# Altium schematic sheet Power Sheet1.SchDoc
size 420 x 297 mm; SheetNumber: 1; SheetTotal: 6
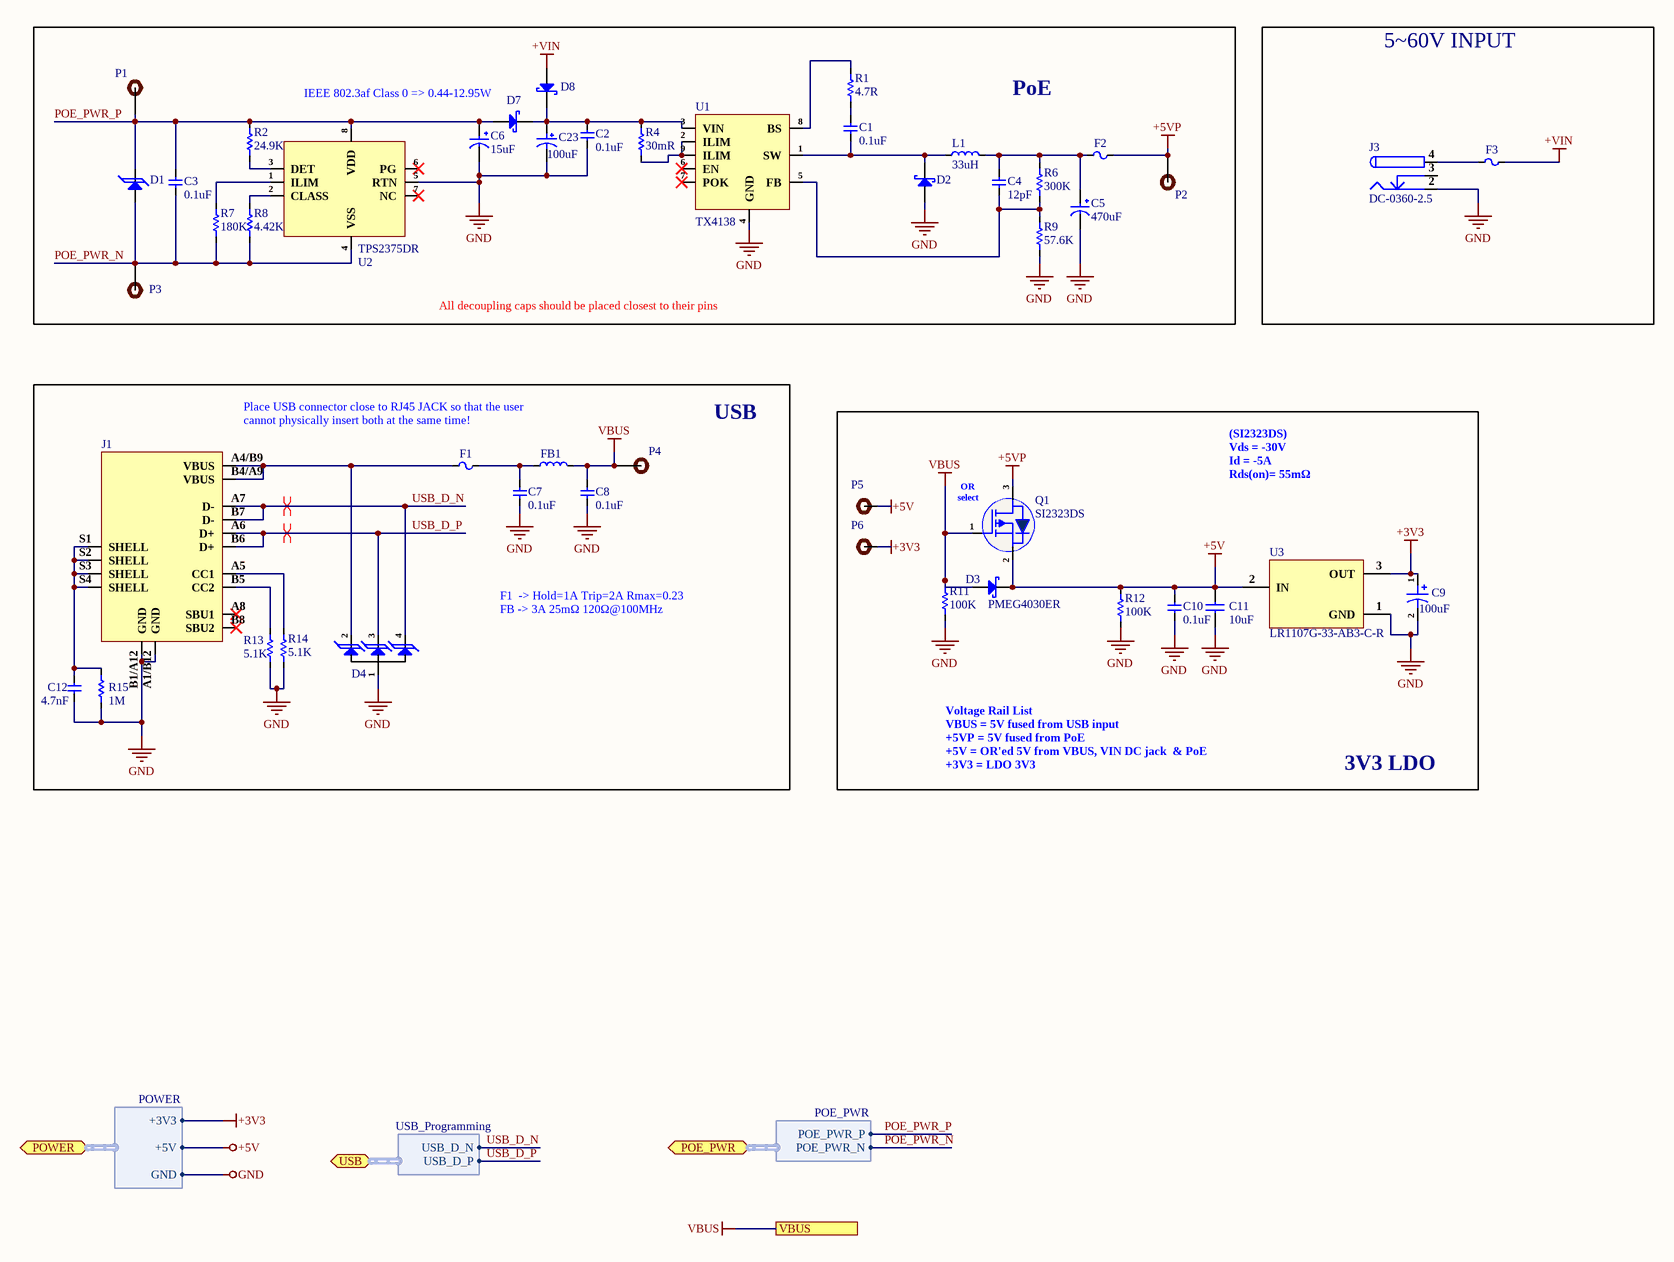
[diagram p0: Power Sheet1.SchDoc]

## Parts
C1  0.1uF  [Cap-0603]
C2  0.1uF  [Cap-0603]
C3  0.1uF  [Cap-0603]
C4  12pF  [Cap-0603]
C5  470uF  [VZH471M1CTR-0810]
C6  15uF  [UD2C150M1010]
C7  0.1uF  [Cap-0402]
C8  0.1uF  [Cap-0402]
C9  100uF  [UCD1A101MCL1GS]
C10  0.1uF  [Cap-0402]
C11  10uF  [Cap-0603]
C12  4.7nF  [Cap-1206]
C23  100uF  [VKMD1451K101MV]
D1  SMAJ58A  [SMA]  (value not drawn)
D2  SS510B  [SMB_]  (value not drawn)
D3  PMEG4030ER  [SOD-123FL]
D4  SP0503BAHTG  [SOT-143-4_]  (value not drawn)
D7  SS510B  [SMB_]  (value not drawn)
D8  SS510B  [SMB_]  (value not drawn)
F1  BSMD0805L-200  [Fuse-0805]  (value not drawn)
F2  BSMD0805L-200  [Fuse-0805]  (value not drawn)
F3  JFC1206-1100FS  [Fuse 1206 (3216 Metric)]  (value not drawn)
FB1  BLM18SG121TN1D  [IND-0603 (1608 Metric)]  (value not drawn)
J1  TYPE-C-31-M-12  [TYPE-C-31-M-12_]  (value not drawn)
J3  DC-0360-2.5  [DC-0360-2.5]
L1  33uH  [CYH127-33UH]
P1  TEST POINT  [Test-point]  (value not drawn)
P2  TEST POINT  [Test-point]  (value not drawn)
P3  TEST POINT  [Test-point]  (value not drawn)
P4  TEST POINT  [Test-point]  (value not drawn)
P5  TEST POINT  [Test-point]  (value not drawn)
P6  TEST POINT  [Test-point]  (value not drawn)
Q1  SI2323DS  [SOT-23]
R1  4.7R  [Res-0603]
R2  24.9K  [Res-0402]
R4  30mR  [RES-0805]
R6  300K  [Res-0603]
R7  180K  [Res-0603]
R8  4.42K  [Res-0603]
R9  57.6K  [Res-0603]
R11  100K  [Res-0603]
R12  100K  [Res-0603]
R13  5.1K  [Res-0402]
R14  5.1K  [Res-0402]
R15  1M  [Res-0603]
U1  TX4138  [8-SOIC-EP]
U2  TPS2375DR  [SOIC-8]
U3  LR1107G-33-AB3-C-R  [SOT-89-3]

## Blocks framed on the sheet
PoE: C1-C6 C23 D1 D2 D7 D8 F2 L1 P1-P3 R1 R2 R4 R6-R9 U1 U2
5~60V INPUT: F3 J3
USB: C7 C8 C12 D4 F1 FB1 J1 P4 R13-R15
3V3 LDO: C9-C11 D3 P5 P6 Q1 R11 R12 U3

## Ports
POE_PWR (bidir, harness POE_PWR), POWER (bidir, harness POWER), USB (bidir, harness USB_Programming), VBUS

## Harnesses
POWER: +3V3, +5V, GND
USB_Programming: USB_D_N, USB_D_P
POE_PWR: POE_PWR_P, POE_PWR_N

## Nets
+3V3: C9.1 P6.1 U3.3(OUT) ; port POWER.+3V3
+5V: C10.2 C11.1 D3.1(K) P5.1 Q1.2(S) R12.2 U3.2(IN) ; port POWER.+5V
+5VP: F2.2 P2.1 Q1.3(D)
+VIN: D8.1(A) F3.2
GND: C2.1 C5.2 C6.2 C7.1 C8.1 C9.2 C10.1 C11.2 C12.2 C23.2 D2.1(A) D4.1(A) J1.A1/B12(GND) J1.B1/A12(GND) J3.2 R9.1 R11.1 R12.1 R13.1 R14.1 R15.2 U1.4(GND) U2.5(RTN) U3.1(GND) ; port POWER.GND
VBUS: C8.2 D3.2(A) FB1.2 P4.1 Q1.1(G) R11.2 ; port VBUS
POE_PWR_N: C3.1 D1.2(K) P3.1 R7.1 R8.1 U2.4(VSS) ; port POE_PWR.POE_PWR_N
POE_PWR_P: C3.2 C6.1 D1.1(K) D7.1(A) P1.1 R2.2 U2.8(VDD) ; port POE_PWR.POE_PWR_P
USB_D_N: D4.4(K) J1.A7(D-) J1.B7(D-) ; port USB.USB_D_N
USB_D_P: D4.3(K) J1.A6(D+) J1.B6(D+) ; port USB.USB_D_P
NetC1_1: C1.1 D2.2(K) L1.1 U1.1(SW)
NetC1_2: C1.2 R1.1
NetC2_2: C2.2 C23.1 D7.2(K) D8.2(K) R4.2 U1.3(VIN)
NetC4_1: C4.1 R6.1 R9.2 U1.5(FB)
NetC4_2: C4.2 C5.1 F2.1 L1.2 R6.2
NetC7_2: C7.2 F1.2 FB1.1
NetC12_1: C12.1 J1.S1(SHELL) J1.S2(SHELL) J1.S3(SHELL) J1.S4(SHELL) R15.1
NetD4_2: D4.2(K) F1.1 J1.A4/B9(VBUS) J1.B4/A9(VBUS)
NetF3_1: F3.1 J3.4
NetJ1_A5: J1.A5(CC1) R14.2
NetJ1_B5: J1.B5(CC2) R13.2
NetR1_2: R1.2 U1.8(BS)
NetR2_1: R2.1 U2.3(DET)
NetR4_1: R4.1 U1.2(ILIM) U1.9(ILIM)
NetR7_2: R7.2 U2.1(ILIM)
NetR8_2: R8.2 U2.2(CLASS)

Not connected (* = marked no-connect by the designer): J1 A8(SBU1)* B8(SBU2)*; J3 3; U1 6(EN)* 7(POK)*; U2 6(PG)* 7(NC)*

## Layout directives
differential pair; net class USB; differential pair class USB_Lines; rule Impedance Constraint [Min = 87.00    Max = 92.00    ]; rule Matched Net Lengths [Tolerance = 0.508mm]: USB_D_N, USB_D_P

## Notes on the sheet
- IEEE 802.3af Class 0 => 0.44-12.95W
- All decoupling caps should be placed closest to their pins
- Place USB connector close to RJ45 JACK so that the user
  cannot physically insert both at the same time!
- (SI2323DS)
  Vds = -30V
  Id = -5A
  Rds(on)= 55mΩ
- (near Q1) OR
  select
- F1  -> Hold=1A Trip=2A Rmax=0.23
  FB -> 3A 25mΩ 120Ω@100MHz
- Voltage Rail List
  VBUS = 5V fused from USB input
  +5VP = 5V fused from PoE
  +5V = OR'ed 5V from VBUS, VIN DC jack  & PoE
  +3V3 = LDO 3V3
- File:
- Title:
- Date:
- Page
- Num:
- Total:
- Drawn By: Huzaifa Ali

## Library data of the parts
C1-C3 = CC0603KRX7R0BB104: CAP CER 0.1UF 100V X7R 0603; Manufacturer: Yageo; Capacitance: 100nF; Tolerance: 10%; Item Type: Capacitor; Supplier 1: Digi-Key; Manufacturer Part Number: CC0603KRX7R0BB104; RoHS: Yes; Category: Ceramic Capacitors; Stock 1: 60476; Pricing 1: 1=0.19000, 10=0.13500, 50=0.07680, 100=0.06370, 500=0.04466, 1000=0.03696 (USD); Mount: Surface Mount; Case/Package: 0603; Case Code (Metric): 1608; Case Code (Imperial): 0603; Weight: 7.1E-05oz; Min Operating Temperature: -55°C; Max Operating Temperature: 125°C; Package Quantity: 4000; Voltage Rating: 100V; Packaging: Tape and Reel; Dielectric: X7R; Termination: SMD/SMT; Resistor Type: Ceramic; Voltage Rating (DC): 100V; Series: CC; Length: 0.063inch; Width: 0.031inch; Thickness: 0.035inch; Depth: 0.8mm; Lead Free: Lead Free; RoHS Compliant: Yes; ComponentLink1URL: https://datasheet.ciiva.com/6277/mlccorderingcode-6277030.pdf?src-supplier=Digi-Key; ComponentLink1Description: https://datasheet.ciiva.com/6277/mlccorderingcode-6277030.pdf?src-supplier=Digi-Key; ComponentLink2URL: https://datasheet.ciiva.com/6277/mlccorderingcode-6277081.pdf?src-supplier=Digi-Key; ComponentLink2Description: https://datasheet.ciiva.com/6277/mlccorderingcode-6277081.pdf?src-supplier=Digi-Key; ComponentLink3URL: https://datasheet.ciiva.com/6277/mlccorderingcode-6277082.pdf?src-supplier=Digi-Key; ComponentLink3Description: https://datasheet.ciiva.com/6277/mlccorderingcode-6277082.pdf?src-supplier=Digi-Key; Supplier Part Number 1: 311-1523-1-ND; LCSC Part Number: C113803
C4 = CC0603JRNPO9BN120: CAP CER 12PF 50V C0G/NPO 0603; Manufacturer: Yageo; Manufacturer Part Number: CC0603J*NPO9B*120; Dielectric Material: Ceramic; Tolerance: 5%; Dielectric: C0G; Insulation Resistance: 100GR; ComponentLink1URL: http://www.kemet.com/kemet/web/homepage/kechome.nsf/file/F9080B_0402_Series_C0G/$file/F9080B_0402_Series_C0G.pdf?src-supplier=Element14; ComponentLink1Description: http://www.kemet.com/kemet/web/homepage/kechome.nsf/file/F9080B_0402_Series_C0G/$file/F9080B_0402_Series_C0G.pdf?src-supplier=Element14; ComponentLink2URL: http://www.farnell.com/datasheets/1372242.pdf?src-supplier=Element14; ComponentLink2Description: http://www.farnell.com/datasheets/1372242.pdf?src-supplier=Element14; Supplier 1: Digi-Key; Stock 1: 141041; Pricing 1: 1=0.1, 10=0.065, 100=0.0288, 500=0.0206, 1000=0.0162 (USD); Number of Pins: 2; Capacitance: 12pF; Packaging: Cut Tape; Voltage Rating (DC): 50V; REACH SVHC: No SVHC; Lead Free: Lead Free; Supplier Part Number 1: 311-1059-1-ND; LCSC Part Number: C107034
C5 = VZH471M1CTR-0810: 470uF 16V ±20% SMD,D8xL10mm Aluminum Electrolytic Capacitors - SMD ROHS; Manufacturer: Lelon; Manufacturer Part Number: VZH471M1CTR-0810; Package: SMD,D8xL10mm; LCSC Part Number: C164069; Item Type: Capacitor; ComponentLink1Description: LCSC; ComponentLink1URL: https://www.lcsc.com/product-detail/Aluminum-Electrolytic-Capacitors-SMD_Lelon-VZH471M1CTR-0810_C164069.html
C6 = UD2C150M1010: 15uF 160V ±20% SMD,D10xL10.2mm Aluminum Electrolytic Capacitors - SMD ROHS; Manufacturer: Honor Elec; Manufacturer Part Number: UD2C150M1010; Package: SMD,D10xL10.2mm; LCSC Part Number: C98557; Item Type: Capacitor; ComponentLink1Description: LCSC; ComponentLink1URL: https://www.lcsc.com/product-detail/Aluminum-Electrolytic-Capacitors-SMD_Honor-Elec-UD2C150M1010_C98557.html
C7 C8 C10 = C1005X5R1H104K050BB: CAP CER 0.1UF 50V X5R 0402; Manufacturer: TDK; Dielectric Material: Ceramic; Capacitance: 100nF; Tolerance: 10%; Supplier 1: Digi-Key; Manufacturer Part Number: C1005X5R1H104K050BB; Stock 1: 1455182; Pricing 1: 1=0.12, 10=0.09, 50=0.049, 100=0.04, 500=0.02858, 1000=0.02245, 2500=0.02041, 5000=0.01878 (USD); Mount: Surface Mount; Case/Package: 0402; Case Code (Metric): 1005; Case Code (Imperial): 0402; Weight: 2.3E-05oz; Min Operating Temperature: -55°C; Max Operating Temperature: 85°C; Dielectric: X5R; Voltage Rating: 50V; Packaging: Tape and Reel; Voltage Rating (DC): 50V; Termination: SMD/SMT; Construction: Flat; Package Quantity: 1; Resistor Type: Ceramic; Voltage: 50V; Series: C; Length: 1mm; Width: 0.02inch; Height: 0.5mm; Depth: 0.5mm; Thickness: 0.022inch; Radiation Hardening: No; Lead Free: Lead Free; REACH SVHC: No SVHC; RoHS Compliant: Yes; ComponentLink1URL: https://product.tdk.com/info/en/catalog/spec/mlccspec_commercial_general_midvoltage_en.pdf?src-supplier=Digi-Key; ComponentLink1Description: https://product.tdk.com/info/en/catalog/spec/mlccspec_commercial_general_midvoltage_en.pdf?src-supplier=Digi-Key; ComponentLink2URL: http://www.tdk.co.jp/tefe02/e413_c.pdf?src-supplier=Future+Electronics; ComponentLink2Description: http://www.tdk.co.jp/tefe02/e413_c.pdf?src-supplier=Future+Electronics; ComponentLink3URL: https://www.verical.com/server-webapp/html/getDatasheet?partID=743571&src-supplier=Verical; ComponentLink3Description: https://www.verical.com/server-webapp/html/getDatasheet?partID=743571&src-supplier=Verical; ComponentLink4URL: http://www.tdk.co.jp/tefe02/e412_c.pdf?src-supplier=Avnet+Europe; ComponentLink4Description: http://www.tdk.co.jp/tefe02/e412_c.pdf?src-supplier=Avnet+Europe; Supplier Part Number 1: 445-5942-1-ND; LCSC Part Number: C2181865
C9 = UCD1A101MCL1GS: CAP ALUM 100UF 20% 10V SMD; Manufacturer: Nichicon; Ripple Current: 240mA; Impedance: 360mR; Leakage Current: 10uA; Polarity: Polar; Dissipation Factor: 0.19%; Life (Hours): 2000Hour; Item Type: Capacitor; Supplier 1: Digi-Key; Manufacturer Part Number: UCD1A101MCL1GS; RoHS: Yes; Category: Aluminum Electrolytic Capacitors; Stock 1: 6029; Pricing 1: 1=0.51000, 10=0.35900, 50=0.27160, 100=0.23660, 500=0.17526 (USD); Mount: Surface Mount; Case/Package: Radial; Min Operating Temperature: -55°C; Max Operating Temperature: 105°C; Capacitance: 100uF; Packaging: Tape and Reel; Package Quantity: 1000; Voltage Rating: 10V; Voltage Rating (DC): 10V; Tolerance: 20%; Termination: SMD/SMT; Voltage: 10V; Series: CD; Construction: Cylindrical; Diameter: 6.3mm; Length: 5.8mm; Height: 5.8mm; Height - Seated (Max): 0.24inch; Radiation Hardening: No; RoHS Compliant: Yes; ComponentLink1URL: https://datasheet.ciiva.com/11776/0900766b80ebdadd-11776792.pdf?src-supplier=RSComponents; ComponentLink1Description: https://datasheet.ciiva.com/11776/0900766b80ebdadd-11776792.pdf?src-supplier=RSComponents; ComponentLink2URL: https://datasheet.ciiva.com/111/e-cd-111628.pdf?src-supplier=Digi-Key; ComponentLink2Description: https://datasheet.ciiva.com/111/e-cd-111628.pdf?src-supplier=Digi-Key; ComponentLink3URL: https://datasheet.ciiva.com/11686/e-cd-11686168.pdf?src-supplier=Avnet; ComponentLink3Description: https://datasheet.ciiva.com/11686/e-cd-11686168.pdf?src-supplier=Avnet; Supplier Part Number 1: 493-14563-1-ND; LCSC Part Number: C340720
C11 = CC0603KRX5R7BB106: CAP CER 10UF 16V X5R 0603; Manufacturer: Yageo; Tolerance: 10%; Item Type: Capacitor; Supplier 1: Digi-Key; Manufacturer Part Number: CC0603KRX5R7BB106; RoHS: Yes; Category: Ceramic Capacitors; Stock 1: 240725; Pricing 1: 1=0.68000, 10=0.48000, 50=0.36300, 100=0.31610, 500=0.23416, 1000=0.19903 (USD); Mount: Surface Mount; Case/Package: 0603; Case Code (Imperial): 0603; Case Code (Metric): 1608; Min Operating Temperature: -55°C; Max Operating Temperature: 85°C; Packaging: Cut Tape; Capacitance: 10uF; Voltage Rating: 16V; RoHS Compliant: Yes; ComponentLink1URL: http://www.yageo.com/documents/recent/UPY-GPHC_X5R_4V-to-50V_25.pdf?src-supplier=Digi-Key; ComponentLink1Description: http://www.yageo.com/documents/recent/UPY-GPHC_X5R_4V-to-50V_25.pdf?src-supplier=Digi-Key; Supplier Part Number 1: 311-3486-1-ND; LCSC Part Number: C2936601
C12 = CC1206KKX7RCBB472: CAP CER 4700PF 1KV X7R 1206; Manufacturer: Yageo; Dielectric Material: Ceramic; Tolerance: 10%; Item Type: Capacitor; Supplier 1: Future Electronics; Manufacturer Part Number: CC1206KKX7RCBB472; RoHS: Yes; Category: Ceramic Capacitors; Stock 1: 180000; Pricing 1: 3000=0.02860, 9000=0.02750, 15000=0.02700, 45000=0.02600, 75000=0.02510 (USD); Mount: Surface Mount; Case/Package: 1206; Number of Pins: 2; Case Code (Imperial): 1206; Case Code (Metric): 3216; Weight: 0.000571oz; Min Operating Temperature: -55°C; Max Operating Temperature: 125°C; Voltage Rating: 1kV; Capacitance: 4.7nF; Packaging: Tape and Reel; Voltage Rating (DC): 1kV; Dielectric: X7R; Termination: SMD/SMT; Resistor Type: Ceramic; Series: CC; Length: 3.2mm; Width: 0.063inch; Thickness: 0.057inch; Depth: 1.6mm; Radiation Hardening: No; Lead Free: Lead Free; RoHS Compliant: Yes; ComponentLink1URL: https://datasheet.ciiva.com/13208/upy-gp-np0-16v-to-50v-8-13208693.pdf?src-supplier=Mouser; ComponentLink1Description: https://datasheet.ciiva.com/13208/upy-gp-np0-16v-to-50v-8-13208693.pdf?src-supplier=Mouser; ComponentLink2URL: https://datasheet.ciiva.com/11466/hv-11466701.pdf?src-supplier=Avnet; ComponentLink2Description: https://datasheet.ciiva.com/11466/hv-11466701.pdf?src-supplier=Avnet; Supplier Part Number 1: 7130131; LCSC Part Number: C107198
C23 = VKMD1451K101MV: 100uF 80V 735mA@100kHz ±20% SMD,D8xL14.5mm Aluminum Electrolytic Capacitors - SMD ROHS; Manufacturer: Ymin; Manufacturer Part Number: VKMD1451K101MV; Package: SMD,D8xL14.5mm; LCSC Part Number: C487409; Item Type: Capacitor; ComponentLink1Description: LCSC; ComponentLink1URL: https://www.lcsc.com/product-detail/Aluminum-Electrolytic-Capacitors-SMD_Ymin-VKMD1451K101MV_C487409.html
D1 = SMAJ58A: 93.6V 64.4V 58V SMA(DO-214AC) TVS ROHS; Manufacturer: Yangzhou Yangjie Elec Tech; Item Type: Diode; Manufacturer Part Number: SMAJ58A; Package: SMA(DO-214AC); LCSC Part Number: C698958; ComponentLink1Description: LCSC; ComponentLink1URL: https://www.lcsc.com/product-detail/TVS_Yangzhou-Yangjie-Elec-Tech-SMAJ58A_C698958.html
D2 D7 D8 = SS510B: SCHOTTKY DIODE SMB 100V 5A; Manufacturer: MDD; Manufacturer Part Number: SS510B; Package: SMB; ComponentLink1Description: LCSC; ComponentLink1URL: https://www.lcsc.com/product-detail/Schottky-Barrier-Diodes-SBD_JUXING-SS510B_C3011128.html; LCSC Part Number: C3011128; Item Type: Diode
D3 = PMEG4030ER: SOD-123FL Schottky Barrier Diodes (SBD) ROHS; Manufacturer: Shikues; Item Type: Diode; Manufacturer Part Number: PMEG4030ER; Package: SOD-123FL; LCSC Part Number: C5366303; ComponentLink1Description: LCSC; ComponentLink1URL: https://www.lcsc.com/product-detail/Schottky-Barrier-Diodes-SBD_Shikues-PMEG4030ER_C5366303.html
D4 = SP0503BAHTG: ESD Suppressor TVS 5.5V 4-Pin(3+Tab) SOT-143 T/R; Manufacturer: Littelfuse; Element Configuration: Common Anode; Direction: Unidirectional; Capacitance: 30pF; Number of Channels: 3; Clamping Voltage: 7.8V; Power Line Protection: No; Polarity: Bidirectional,Unidirectional; Max Power Dissipation: 225mW; ESD Protection: Yes; Max Reverse Leakage Current: 100nA; Voltage Rating (DC): 5V; Diode Type: Avalanche; Clamping Voltage-Max: 8V; Supplier 1: Digi-Key; Manufacturer Part Number: SP0503BAHTG; RoHS: Yes; Category: Diodes; Stock 1: 651; Pricing 1: 1=0.92000, 10=0.81200, 100=0.62260, 500=0.49214, 1000=0.39371 (USD); Mount: Surface Mount; Case/Package: SOT-143; Number of Pins: 4; Min Operating Temperature: -40°C; Max Operating Temperature: 85°C; Operating Supply Voltage: 5.5V; Packaging: Tape and Reel; Number of Unidirectional Channels: 3; Reverse Standoff Voltage: 5.5V; Breakdown Voltage: 5.5V; Termination: SMD/SMT; Working Voltage: 5.5V; Peak Pulse Power: 225mW; Leakage Current: 100nA; Number of Elements: 3; Power Dissipation: 225mW; Resistor Type: Zener; Series: SP05, SPA®; Length: 3.04mm; Width: 1.4mm; Height: 1.05mm; Depth: 1.4mm; Radiation Hardening: No; REACH SVHC: No SVHC; Lead Free: Lead Free; RoHS Compliant: Yes; ComponentLink1URL: https://datasheet.ciiva.com/15143/getdatasheetpartid-116020-15143550.pdf?src-supplier=Verical; ComponentLink1Description: https://datasheet.ciiva.com/15143/getdatasheetpartid-116020-15143550.pdf?src-supplier=Verical; ComponentLink2URL: https://datasheet.ciiva.com/332/sp05xxba-332550.pdf?src-supplier=Digi-Key; ComponentLink2Description: https://datasheet.ciiva.com/332/sp05xxba-332550.pdf?src-supplier=Digi-Key; ComponentLink3URL: https://datasheet.ciiva.com/8062/littefuse-spa-sp050x-8062422.pdf?src-supplier=Element14; ComponentLink3Description: https://datasheet.ciiva.com/8062/littefuse-spa-sp050x-8062422.pdf?src-supplier=Element14; ComponentLink4URL: https://datasheet.ciiva.com/22697/1911798-22697942.pdf?src-supplier=Element14; ComponentLink4Description: https://datasheet.ciiva.com/22697/1911798-22697942.pdf?src-supplier=Element14; ComponentLink5URL: https://datasheet.ciiva.com/332/sp05xxba-332551.pdf?src-supplier=Digi-Key; ComponentLink5Description: https://datasheet.ciiva.com/332/sp05xxba-332551.pdf?src-supplier=Digi-Key; ComponentLink6URL: https://datasheet.ciiva.com/16449/sp05xxba-16449463.pdf?src-supplier=Future+Electronics; ComponentLink6Description: https://datasheet.ciiva.com/16449/sp05xxba-16449463.pdf?src-supplier=Future+Electronics; ComponentLink7URL: https://datasheet.ciiva.com/332/sp05xxba-332552.pdf?src-supplier=Digi-Key; ComponentLink7Description: https://datasheet.ciiva.com/332/sp05xxba-332552.pdf?src-supplier=Digi-Key; ComponentLink8URL: https://datasheet.ciiva.com/4509/sp05x-leadfree-4509162.pdf?src-supplier=Mouser; ComponentLink8Description: https://datasheet.ciiva.com/4509/sp05x-leadfree-4509162.pdf?src-supplier=Mouser; ComponentLink9URL: https://datasheet.ciiva.com/7650/526672-7650894.pdf?src-supplier=Element14; ComponentLink9Description: https://datasheet.ciiva.com/7650/526672-7650894.pdf?src-supplier=Element14; Supplier Part Number 1: F2715CT-ND; LCSC Part Number: C3029025
F1 F2 = BSMD0805L-200: 6V 2A 50A 1W -40℃~+85℃ 4A 4mΩ 5s 45mΩ 0805 Resettable Fuses ROHS; Manufacturer: BHFUSE; Item Type: Fuse; Manufacturer Part Number: BSMD0805L-200; Package: 0805; LCSC Part Number: C2757931; ComponentLink1Description: LCSC; ComponentLink1URL: https://www.lcsc.com/product-detail/Resettable-Fuses_BHFUSE-BSMD0805L-200_C2757931.html
F3 = JFC1206-1100FS: 50A SMD Fuse 1A 63V 63V 1206 Disposable fuses ROHS / PTC RESET FUSE 6V 3A 1206; Manufacturer: Shenzhen JDT Fuse; LCSC Part Number: C136343; Item Type: Fuse; Manufacturer Part Number: JFC1206-1100FS; ComponentLink1Description: LCSC; ComponentLink1URL: https://www.lcsc.com/product-detail/Disposable-fuses_Shenzhen-JDT-Fuse-JFC1206-1100FS_C136343.html
FB1 = BLM18SG121TN1D: FERRITE BEAD 120 OHM 0603 1LN; Manufacturer: Murata; Material: Steel,Ferrite; Tolerance: 25%; Impedance: 120R; DC Resistance (DCR): 25mR; Max DC Current: 3A; Number of Lines: 1; Test Frequency: 100MHz; Shielding: Unshielded; Supplier 1: Arrow Electronics; Manufacturer Part Number: BLM18SG121TN1D; RoHS: Yes; Category: Ferrite Beads and Chips; Stock 1: 82612; Pricing 1: 1=0.12640, 10=0.08350, 25=0.07210, 100=0.05150, 250=0.04730, 500=0.04110, 1000=0.03420, 3000=0.03360, 6000=0.03320, 15000=0.03270, 30000=0.03200, 75000=0.03150 (USD); Case/Package: 0603; Number of Pins: 2; Core Material: Ferrite; Case Code (Metric): 1608; Case Code (Imperial): 0603; Min Operating Temperature: -55°C; Max Operating Temperature: 125°C; Package Quantity: 1; Max Current Rating: 3A; Packaging: Tape and Reel; Current Rating: 3A; Termination: SMD/SMT; Frequency: 100MHz; Number of Circuits: 1; Series: BLM18S; DC Resistance-Max: 25mR; Length: 1.6mm; Width: 0.8mm; Height: 0.8mm; Depth: 0.8mm; Reach SVHC Compliant: Yes; Lead Free: Lead Free; RoHS Compliant: Yes; ComponentLink1URL: https://datasheet.ciiva.com/1012/l0110s0100blm18s-1012624.pdf?src-supplier=Digi-Key; ComponentLink1Description: https://datasheet.ciiva.com/1012/l0110s0100blm18s-1012624.pdf?src-supplier=Digi-Key; ComponentLink2URL: https://datasheet.ciiva.com/11799/0900766b811b5866-11799181.pdf?src-supplier=RSComponents; ComponentLink2Description: https://datasheet.ciiva.com/11799/0900766b811b5866-11799181.pdf?src-supplier=RSComponents; ComponentLink3URL: https://datasheet.ciiva.com/18093/getdatasheetpartid-295885-18093249.pdf?src-supplier=Verical; ComponentLink3Description: https://datasheet.ciiva.com/18093/getdatasheetpartid-295885-18093249.pdf?src-supplier=Verical; ComponentLink4URL: https://datasheet.ciiva.com/41449/001171723-da-01-en-chip-drossel0603-120r-3000ma-1-6x0-8mm-41449353.pdf?src-supplier=Conrad; ComponentLink4Description: https://datasheet.ciiva.com/41449/001171723-da-01-en-chip-drossel0603-120r-3000ma-1-6x0-8mm-41449353.pdf?src-supplier=Conrad; ComponentLink5URL: https://datasheet.ciiva.com/41449/001172312-da-01-en-drossel-0603-120r-1-6x0-8mm-10000st-41449675.pdf?src-supplier=Conrad; ComponentLink5Description: https://datasheet.ciiva.com/41449/001172312-da-01-en-drossel-0603-120r-1-6x0-8mm-10000st-41449675.pdf?src-supplier=Conrad; ComponentLink6URL: https://datasheet.ciiva.com/8021/5151-8021511.pdf?src-supplier=Element14; ComponentLink6Description: https://datasheet.ciiva.com/8021/5151-8021511.pdf?src-supplier=Element14; ComponentLink7URL: https://datasheet.ciiva.com/8021/5151-8021512.pdf?src-supplier=Element14; ComponentLink7Description: https://datasheet.ciiva.com/8021/5151-8021512.pdf?src-supplier=Element14; ComponentLink8URL: https://datasheet.ciiva.com/14122/blm-series-eng-tds-14122906.pdf?src-supplier=Distrelec; ComponentLink8Description: https://datasheet.ciiva.com/14122/blm-series-eng-tds-14122906.pdf?src-supplier=Distrelec; ComponentLink9URL: https://datasheet.ciiva.com/1012/l0110s0100blm18s-1012623.pdf?src-supplier=Digi-Key; ComponentLink9Description: https://datasheet.ciiva.com/1012/l0110s0100blm18s-1012623.pdf?src-supplier=Digi-Key; ComponentLink10URL: https://datasheet.ciiva.com/1012/l0110s0100blm18s-1012625.pdf?src-supplier=Digi-Key; ComponentLink10Description: https://datasheet.ciiva.com/1012/l0110s0100blm18s-1012625.pdf?src-supplier=Digi-Key; ComponentLink11URL: https://datasheet.ciiva.com/16395/l0110s0100blm18s-16395498.pdf?src-supplier=Future+Electronics; ComponentLink11Description: https://datasheet.ciiva.com/16395/l0110s0100blm18s-16395498.pdf?src-supplier=Future+Electronics; Supplier Part Number 1: BLM18SG121TN1D; LCSC Part Number: C113030; Item Type: Ferrite Bead
J1 = TYPE-C-31-M-12: 250mA 1 16 Female Type-C SMD USB Connectors ROHS; Manufacturer: Korean Hroparts Elec; ComponentLink1Description: LCSC; ComponentLink1URL: https://www.lcsc.com/product-detail/USB-Connectors_Korean-Hroparts-Elec-TYPE-C-31-M-12_C165948.html; Manufacturer Part Number: TYPE-C-31-M-12; Footprint: Custom; LCSC Part Number: C165948; Item Type: USB Connector
J3 = DC-0360-2.5: DC Power Receptacle 260℃ Brass -20℃~+70℃ 2.5mm 6mm 2.5A 24V Plugin AC/DC Power Connectors ROHS; Manufacturer: XKB Connectivity; Item Type: DC Jack; Manufacturer Part Number: DC-0360-2.5; Package: Plugin; LCSC Part Number: C319122; ComponentLink1Description: LCSC; ComponentLink1URL: https://www.lcsc.com/product-detail/AC-DC-Power-Connectors_XKB-Connectivity-DC-0360-2-5_C319122.html
L1 = CYH127-33UH: 3A 33uH ±20% 64.8mΩ SMD,12.3x12.3mm Inductors (SMD) ROHS; Manufacturer: SHOU HAN; Manufacturer Part Number: CYH127-33UH; Package: SMD,12.3x12.3mm; LCSC Part Number: C2929502; Item Type: Inductor; ComponentLink1Description: LCSC; ComponentLink1URL: https://www.lcsc.com/product-detail/Inductors-SMD_SHOU-HAN-CYH127-33UH_C2929502.html
P1-P6 = TEST POINT: Test Point ON; Item Type: TEST POINT
Q1 = SI2323DS: SOT-23-3 MOSFETs ROHS; Manufacturer: TECH PUBLIC; Item Type: Mosfet; Manufacturer Part Number: SI2323DS; Package: SOT-23-3; LCSC Part Number: C5182044; ComponentLink1Description: LCSC; ComponentLink1URL: https://www.lcsc.com/product-detail/MOSFETs_TECH-PUBLIC-SI2323DS_C5182044.html
R1 = RC0603FR-074R7L: RES 4.7 OHM 1% 1/10W 0603; Manufacturer: Yageo; Voltage Rating: 50V; Power Rating: 100mW; Temperature Coefficient: 200ppm/°C; Item Type: Resistor; Supplier 1: Future Electronics; Manufacturer Part Number: RC0603FR-074R7L; RoHS: Yes; Category: Chip SMD Resistors; Stock 1: 160000; Pricing 1: 5000=0.0036, 25000=0.0034, 125000=0.0032, 250000=0.0031, 750000=0.0029 (USD); Case/Package: 0603; Pins: 2; Case Code (Imperial): 0603; Case Code (Metric): 1608; Min Operating Temperature: -55°C; Max Operating Temperature: 155°C; Package Quantity: 5000; Value: 4.7R; Tolerance: 1%; Packaging: Tape and Reel; Voltage Rating (DC): 50V; Resistor Type: Thick Film; Number of Terminations: 2; Termination: SMD/SMT; Max Power Dissipation: 100mW; Features: Moisture Resistant; Series: RC; Resistance Tolerance: 1%; Length: 1.6mm; Width: 0.8mm; Height: 0.45mm; Lead Free: Lead Free; Reach SVHC Compliant: Unknown; ComponentLink1URL: https://datasheet.ciiva.com/46440/1868787-46440910.pdf?src-supplier=Element14; ComponentLink1Description: https://datasheet.ciiva.com/46440/1868787-46440910.pdf?src-supplier=Element14; ComponentLink2URL: https://datasheet.ciiva.com/12555/rc0603-272842-12555071.pdf?src-supplier=Mouser; ComponentLink2Description: https://datasheet.ciiva.com/12555/rc0603-272842-12555071.pdf?src-supplier=Mouser; Supplier Part Number 1: 3598901; LCSC Part Number: C137705
R2 = RCS040224K9FKED: RES SMD 24.9K OHM 1% 1/5W 0402; Manufacturer: Vishay Dale; Resistance: 24.9kR; Max Power Dissipation: 200mW; Temperature Coefficient: 100ppm/°C; Supplier 1: Digi-Key; Manufacturer Part Number: RCS040224K9FKED; Stock 1: 9225; Pricing 1: 1=0.12, 10=0.105, 100=0.0402, 1000=0.01771, 2500=0.0153, 5000=0.01368 (USD); Case/Package: 0402; Min Operating Temperature: -55°C; Max Operating Temperature: 155°C; Package Quantity: 10000; Packaging: Tape and Reel; Resistor Type: Thick Film; Number of Terminations: 2; Tolerance: 1%; Features: Automotive AEC-Q200; Length: 0.039inch; Width: 0.02inch; Height: 0.016inch; ComponentLink1URL: http://www.vishay.com/docs/20065/rcse3.pdf?src-supplier=Digi-Key; ComponentLink1Description: http://www.vishay.com/docs/20065/rcse3.pdf?src-supplier=Digi-Key; Supplier Part Number 1: 541-RCS040224K9FKEDCT-ND; LCSC Part Number: C1881100
R4 = PE0805FRF470R03L: RES 0.03 OHM 1% 1/2W 0805; Manufacturer: Yageo; Max Power Dissipation: 500mW; Temperature Coefficient: 100ppm/°C; Item Type: Resistor; Supplier 1: Future Electronics; Manufacturer Part Number: PE0805FRF470R03L; RoHS: Yes; Category: Chip SMD Resistors; Stock 1: 20000; Pricing 1: 5000=0.175, 10000=0.171, 15000=0.169, 20000=0.168, 25000=0.164 (USD); Case/Package: 0805; Min Operating Temperature: -55°C; Max Operating Temperature: 170°C; Package Quantity: 5000; Packaging: Tape and Reel; Value: 30mR; Number of Terminations: 2; Tolerance: 1%; Features: Moisture Resistant,Automotive AEC-Q200; Series: PE; Length: 0.08inch; Width: 0.05inch; Height: 0.024inch; RoHS Compliant: Yes; ComponentLink1URL: http://www.mouser.com/ds/2/447/PYu-PE_521_RoHS_L_5-1077989.pdf?src-supplier=Mouser; ComponentLink1Description: http://www.mouser.com/ds/2/447/PYu-PE_521_RoHS_L_5-1077989.pdf?src-supplier=Mouser; ComponentLink2URL: http://www.yageo.com/documents/recent/PYu-PE_521_RoHS_L_5.pdf?src-supplier=Digi-Key; ComponentLink2Description: http://www.yageo.com/documents/recent/PYu-PE_521_RoHS_L_5.pdf?src-supplier=Digi-Key; Supplier Part Number 1: 7123965; LCSC Part Number: C858599
R6 = RC0603FR-07300KL: RES 300K OHM 1% 1/10W 0603; Manufacturer: Yageo; Resistance: 300kR; Power Rating: 100mW; Temperature Coefficient: 100ppm/°C; Voltage Rating (DC): 50V; Item Type: Resistor; Supplier 1: Avnet; Manufacturer Part Number: RC0603FR-07300KL; RoHS: Yes; Category: Chip SMD Resistors; Stock 1: 25000; Pricing 1: 5000=0.00133, 10000=0.00131, 20000=0.00127 (USD); Mount: Surface Mount; Case/Package: 0603; Case Code (Metric): 1608; Case Code (Imperial): 0603; Size Code: 0603; Min Operating Temperature: -55°C; Max Operating Temperature: 155°C; Tolerance: 1%; Packaging: Tape and Reel; Package Quantity: 1; Voltage Rating: 50V; Resistor Type: Thick Film; Number of Terminations: 2; Termination: SMD/SMT; Max Power Dissipation: 100mW; Features: Moisture Resistant; Series: RC; Construction: Rectangular; Length: 0.063inch; Width: 0.031inch; Height: 0.022inch; Depth: 0.8mm; Lead Free: Lead Free; Military Standard: Not; RoHS Compliant: Yes; ComponentLink1URL: https://datasheet.ciiva.com/2454/pyu-r-int-thick-7-2454475.pdf?src-supplier=Digi-Key; ComponentLink1Description: https://datasheet.ciiva.com/2454/pyu-r-int-thick-7-2454475.pdf?src-supplier=Digi-Key; ComponentLink2URL: https://datasheet.ciiva.com/2454/pyu-r-int-thick-7-2454476.pdf?src-supplier=Digi-Key; ComponentLink2Description: https://datasheet.ciiva.com/2454/pyu-r-int-thick-7-2454476.pdf?src-supplier=Digi-Key; ComponentLink3URL: https://datasheet.ciiva.com/2454/pyu-r-int-thick-7-2454474.pdf?src-supplier=Digi-Key; ComponentLink3Description: https://datasheet.ciiva.com/2454/pyu-r-int-thick-7-2454474.pdf?src-supplier=Digi-Key; ComponentLink4URL: https://datasheet.ciiva.com/15189/getdatasheetpartid-348071-15189692.pdf?src-supplier=Verical; ComponentLink4Description: https://datasheet.ciiva.com/15189/getdatasheetpartid-348071-15189692.pdf?src-supplier=Verical; Supplier Part Number 1: RC0603FR-07300KL; LCSC Part Number: C114667
R7 = RC0603FR-07180KL: RES 180K OHM 1% 1/10W 0603; Manufacturer: Yageo; Voltage Rating (DC): 50V; Value: 180kR; Power Rating: 100mW; Temperature Coefficient: 100ppm/°C; Working Voltage: 75V; Item Type: Resistor; Supplier 1: Future Electronics; Manufacturer Part Number: RC0603FR-07180KL; RoHS: Yes; Category: Chip SMD Resistors; Stock 1: 1450000; Pricing 1: 5000=0.0023, 50000=0.0014, 100000=0.0021, 200000=0.0014, 375000=0.002, 625000=0.0013, 1250000=0.002, 2000000=0.0012, 5000000=0.0018 (USD); Case/Package: 0603; Pins: 2; Case Code (Imperial): 0603; Case Code (Metric): 1608; Min Operating Temperature: -55°C; Max Operating Temperature: 155°C; Tolerance: 1%; Voltage Rating: 50V; Package Quantity: 5000; Packaging: Tape and Reel; Termination: SMD/SMT; Resistor Type: Thick Film; Number of Terminations: 2; Max Power Dissipation: 100mW; Features: Moisture Resistant; Series: RC; Resistance Tolerance: 1%; Technology: THICK FILM; Length: 1.6mm; Width: 0.8mm; Height: 0.45mm; Depth: 0.8mm; Lead Free: Lead Free; RoHS Compliant: Yes; Reach SVHC Compliant: Unknown; ComponentLink1URL: https://datasheet.ciiva.com/2508/pyu-r-int-thick-7-2508493.pdf?src-supplier=Digi-Key; ComponentLink1Description: https://datasheet.ciiva.com/2508/pyu-r-int-thick-7-2508493.pdf?src-supplier=Digi-Key; ComponentLink2URL: https://datasheet.ciiva.com/2508/pyu-r-int-thick-7-2508491.pdf?src-supplier=Digi-Key; ComponentLink2Description: https://datasheet.ciiva.com/2508/pyu-r-int-thick-7-2508491.pdf?src-supplier=Digi-Key; ComponentLink3URL: https://datasheet.ciiva.com/5561/rc0603-272842-5561848.pdf?src-supplier=Mouser; ComponentLink3Description: https://datasheet.ciiva.com/5561/rc0603-272842-5561848.pdf?src-supplier=Mouser; ComponentLink4URL: https://datasheet.ciiva.com/7746/443971-7746265.pdf?src-supplier=Element14; ComponentLink4Description: https://datasheet.ciiva.com/7746/443971-7746265.pdf?src-supplier=Element14; ComponentLink5URL: https://datasheet.ciiva.com/7746/443971-7746264.pdf?src-supplier=Element14; ComponentLink5Description: https://datasheet.ciiva.com/7746/443971-7746264.pdf?src-supplier=Element14; Supplier Part Number 1: 8145930; LCSC Part Number: C123419
R8 = AC0603FR-074K42L: RES SMD 4.42K OHM 1% 1/10W 0603; Manufacturer: Yageo; Power Rating: 100mW; Value: 4.42kR; Voltage Rating: 50V; Temperature Coefficient: 100ppm/°C; Item Type: Resistor; Supplier 1: Rs; Manufacturer Part Number: AC0603FR-074K42L; RoHS: Yes; Category: Chip SMD Resistors; Stock 1: 8500; Pricing 1: 2500=0.006, 5000=0.005, 7500=0.004, 10000=0.003 (GBP); Case/Package: 0603; Case Code (Imperial): 0603; Case Code (Metric): 1608; Weight: 7.1E-05oz; Min Operating Temperature: -55°C; Max Operating Temperature: 155°C; Tolerance: 1%; Packaging: Tape and Reel; Number of Terminations: 2; Termination: SMD/SMT; Max Power Dissipation: 100mW; Features: Moisture Resistant,Automotive AEC-Q200; Series: AC; Length: 0.063inch; Width: 0.8mm; Height: 0.022inch; Ratings: AEC-Q200; RoHS Compliant: Yes; ComponentLink1URL: https://datasheet.ciiva.com/12576/pyu-ac-51-rohs-l-2-12576475.pdf?src-supplier=Mouser; ComponentLink1Description: https://datasheet.ciiva.com/12576/pyu-ac-51-rohs-l-2-12576475.pdf?src-supplier=Mouser; Supplier Part Number 1: 1978073P; LCSC Part Number: C227930
R9 = RT0603BRE0757K6L: RES SMD 57.6KOHM 0.1% 1/10W 0603; Manufacturer: YAGEO; Item Type: Resistor; Manufacturer Part Number: RT0603BRE0757K6L; Package: 0603; LCSC Part Number: C849817; ComponentLink1Description: LCSC; ComponentLink1URL: https://www.lcsc.com/product-detail/Chip-Resistor-Surface-Mount_YAGEO-RT0603BRE0757K6L_C849817.html
R11 R12 = RC0603JR-07100KL: RES 100K OHM 5% 1/10W 0603; Manufacturer: Yageo; Resistance: 100kR; Temperature Coefficient: 100ppm/°C; Voltage Rating: 50V; Power Rating: 100mW; Item Type: Resistor; Supplier 1: Digi-Key; Manufacturer Part Number: RC0603JR-07100KL; RoHS: Yes; Category: Chip SMD Resistors; Stock 1: 1210037; Pricing 1: 1=0.10000, 10=0.02000, 100=0.00800, 1000=0.00360, 2500=0.00312 (USD); Case/Package: 0603; Number of Pins: 2; Contact Plating: Tin,Matte; Case Code (Imperial): 0603; Case Code (Metric): 1608; Size Code: 0603; Min Operating Temperature: -55°C; Max Operating Temperature: 155°C; Tolerance: 5%; Resistor Type: Thick Film; Packaging: Tape and Reel; Voltage Rating (DC): 50V; Termination: SMD/SMT; Features: Moisture Resistant; Series: RC; Max Power Dissipation: 100mW; Number of Terminations: 2; Resistance Tolerance: 5%; Width: 0.8mm; Radiation Hardening: No; REACH SVHC: No SVHC; Lead Free: Lead Free; RoHS Compliant: Yes; ComponentLink1URL: https://datasheet.ciiva.com/7746/443971-7746424.pdf?src-supplier=Element14; ComponentLink1Description: https://datasheet.ciiva.com/7746/443971-7746424.pdf?src-supplier=Element14; ComponentLink2URL: https://datasheet.ciiva.com/7983/443971-7983686.pdf?src-supplier=Element14; ComponentLink2Description: https://datasheet.ciiva.com/7983/443971-7983686.pdf?src-supplier=Element14; ComponentLink3URL: https://datasheet.ciiva.com/7746/443971-7746423.pdf?src-supplier=Element14; ComponentLink3Description: https://datasheet.ciiva.com/7746/443971-7746423.pdf?src-supplier=Element14; ComponentLink4URL: https://datasheet.ciiva.com/8887/pyu-rc0603-51-rohs-l-4-8887903.pdf?src-supplier=Avnet; ComponentLink4Description: https://datasheet.ciiva.com/8887/pyu-rc0603-51-rohs-l-4-8887903.pdf?src-supplier=Avnet; Supplier Part Number 1: 311-100KGRCT-ND; LCSC Part Number: C100048
R13 R14 = RC0402FR-075K1L: RES 5.1K OHM 1% 1/16W 0402; Manufacturer: Yageo; Power Rating: 63mW; Resistance: 5.1kR; Temperature Coefficient: 100ppm/°C; Voltage Rating: 50V; Item Type: Resistor; Supplier 1: Avnet; Manufacturer Part Number: RC0402FR-075K1L; RoHS: Yes; Category: Chip SMD Resistors; Stock 1: 65000; Pricing 1: 10000=0.00085 (USD); Case/Package: 0402; Case Code (Metric): 1005; Case Code (Imperial): 0402; Min Operating Temperature: -55°C; Max Operating Temperature: 155°C; Tolerance: 1%; Technology: THICK FILM; Packaging: Tape and Reel; Package Quantity: 1; Resistor Type: Thick Film; Number of Terminations: 2; Termination: SMD/SMT; Max Power Dissipation: 63mW; Voltage Rating (DC): 50V; Working Voltage: 50V; Features: Moisture Resistant; Series: RC; Resistance Tolerance: 1%; Construction: Rectangular; Length: 1mm; Width: 0.02inch; Height: 0.016inch; Depth: 0.5mm; RoHS Compliant: Yes; Military Standard: Not; Lead Free: Lead Free; ComponentLink1URL: https://datasheet.ciiva.com/7983/1018594-7983519.pdf?src-supplier=Element14; ComponentLink1Description: https://datasheet.ciiva.com/7983/1018594-7983519.pdf?src-supplier=Element14; ComponentLink2URL: https://datasheet.ciiva.com/46394/1018594-46394936.pdf?src-supplier=Element14; ComponentLink2Description: https://datasheet.ciiva.com/46394/1018594-46394936.pdf?src-supplier=Element14; ComponentLink3URL: https://datasheet.ciiva.com/2453/pyu-r-int-thick-7-2453401.pdf?src-supplier=Digi-Key; ComponentLink3Description: https://datasheet.ciiva.com/2453/pyu-r-int-thick-7-2453401.pdf?src-supplier=Digi-Key; ComponentLink4URL: https://datasheet.ciiva.com/2453/pyu-r-int-thick-7-2453402.pdf?src-supplier=Digi-Key; ComponentLink4Description: https://datasheet.ciiva.com/2453/pyu-r-int-thick-7-2453402.pdf?src-supplier=Digi-Key; ComponentLink5URL: https://datasheet.ciiva.com/2453/pyu-r-int-thick-7-2453400.pdf?src-supplier=Digi-Key; ComponentLink5Description: https://datasheet.ciiva.com/2453/pyu-r-int-thick-7-2453400.pdf?src-supplier=Digi-Key; ComponentLink6URL: https://datasheet.ciiva.com/12558/pyu-rc0402-51-rohs-l-6-r-8721-12558460.pdf?src-supplier=Mouser; ComponentLink6Description: https://datasheet.ciiva.com/12558/pyu-rc0402-51-rohs-l-6-r-8721-12558460.pdf?src-supplier=Mouser; ComponentLink7URL: https://datasheet.ciiva.com/16744/pyu-rc0402-51-rohs-l-6-r-16744283.pdf?src-supplier=Future+Electronics; ComponentLink7Description: https://datasheet.ciiva.com/16744/pyu-rc0402-51-rohs-l-6-r-16744283.pdf?src-supplier=Future+Electronics; ComponentLink8URL: https://datasheet.ciiva.com/15189/getdatasheetpartid-323636-15189493.pdf?src-supplier=Verical; ComponentLink8Description: https://datasheet.ciiva.com/15189/getdatasheetpartid-323636-15189493.pdf?src-supplier=Verical; Supplier Part Number 1: RC0402FR-075K1L; LCSC Part Number: C137973
R15 = RC0603FR-071ML: RES SMD 1M OHM 1% 1/10W 0603; Manufacturer: Yageo; Voltage Rating: 50V; Resistance: 1MR; Power Rating: 100mW; Temperature Coefficient: 100ppm/°C; Supplier 1: Digi-Key; Manufacturer Part Number: RC0603FR-071ML; Stock 1: 3824601; Pricing 1: 1=0.1, 10=0.023, 100=0.0094, 1000=0.00421, 2500=0.00366 (USD); Case/Package: 0603; Number of Pins: 2; Case Code (Imperial): 0603; Case Code (Metric): 1608; Min Operating Temperature: -55°C; Max Operating Temperature: 155°C; Voltage Rating (DC): 50V; Tolerance: 1%; Packaging: Tape and Reel; Package Quantity: 5000; Termination: SMD/SMT; Composition: Thick Film; Military Standard: Not; Length: 1.6mm; Height: 0.45mm; Width: 0.8mm; Depth: 0.8mm; REACH SVHC: No SVHC; Lead Free: Lead Free; ComponentLink1URL: http://www.farnell.com/datasheets/2167052.pdf?src-supplier=Mouser; ComponentLink1Description: http://www.farnell.com/datasheets/2167052.pdf?src-supplier=Mouser; ComponentLink2URL: http://www.farnell.com/datasheets/2167052.pdf?src-supplier=Element14; ComponentLink2Description: http://www.farnell.com/datasheets/2167052.pdf?src-supplier=Element14; ComponentLink3URL: http://documents.rs-components.com/techlib://itc_doclist_GB.htm?stockno=5048956&src-supplier=RSComponents; ComponentLink3Description: http://documents.rs-components.com/techlib://itc_doclist_GB.htm?stockno=5048956&src-supplier=RSComponents; Supplier Part Number 1: 311-1.00MHRDKR-ND; LCSC Part Number: C105578
U1 = TX4138: Step-down type SOIC-8-EP DC-DC Converters ROHS; Manufacturer: XDS; Item Type: IC; Manufacturer Part Number: TX4138; Package: SOIC-8-EP; LCSC Part Number: C329267; ComponentLink1Description: LCSC; ComponentLink1URL: https://www.lcsc.com/product-detail/DC-DC-Converters_XDS-TX4138_C329267.html
U2 = TPS2375DR: IC POE CNTRL 1 CHANNEL 8SOIC; Manufacturer: Texas Instruments; Max Power Dissipation: 12.95W; Operating Supply Current: 240uA; Min Current Limit: 405mA; Output Current: 450mA; Number of Channels: 1; Max Supply Voltage: 57V; Min Supply Voltage: 0V; Power Dissipation: 13W; Supplier 1: Mouser; Manufacturer Part Number: TPS2375DR; RoHS: Yes; Category: Interface ICs; Stock 1: 12566; Pricing 1: 1=2.94, 10=2.65, 50=2.5, 100=2.13, 1000=1.45, 10000=1.29 (USD); Case/Package: D; Pins: 8; Weight: 0.002561oz; Min Operating Temperature: -40°C; Max Operating Temperature: 85°C; Packaging: Tape and Reel; Package Quantity: 2500; Series: -; Length: 5mm; Height: 1.58mm; Radiation Hardening: No; Lead Free: Lead Free; RoHS Compliant: Yes; ComponentLink1URL: https://datasheet.ciiva.com/1943/tps2375-1943071.pdf?src-supplier=Digi-Key; ComponentLink1Description: https://datasheet.ciiva.com/1943/tps2375-1943071.pdf?src-supplier=Digi-Key; ComponentLink2URL: https://datasheet.ciiva.com/1943/tps2375-1943070.pdf?src-supplier=Digi-Key; ComponentLink2Description: https://datasheet.ciiva.com/1943/tps2375-1943070.pdf?src-supplier=Digi-Key; ComponentLink3URL: https://datasheet.ciiva.com/1943/tps2375-1943072.pdf?src-supplier=Digi-Key; ComponentLink3Description: https://datasheet.ciiva.com/1943/tps2375-1943072.pdf?src-supplier=Digi-Key; ComponentLink4URL: https://datasheet.ciiva.com/14248/tps2375-14248055.pdf?src-supplier=Avnet; ComponentLink4Description: https://datasheet.ciiva.com/14248/tps2375-14248055.pdf?src-supplier=Avnet; Supplier Part Number 1: 595-TPS2375DR; LCSC Part Number: C2867397; Item Type: IC
U3 = LR1107G-33-AB3-C-R: 600mA 60dB 500mV@(600mA) Fixed 3.3V~3.3V Positive 1 7V SOT-89(SOT-89-3) Linear Voltage Regulators (LDO) ROHS; Manufacturer: UTC(Unisonic Tech); Item Type: IC; Manufacturer Part Number: LR1107G-33-AB3-C-R; Package: SOT-89(SOT-89-3); LCSC Part Number: C171498; ComponentLink1Description: LCSC; ComponentLink1URL: https://lcsc.com/product-detail/Linear-Voltage-Regulators-LDO_UTC-Unisonic-Tech-LR1107G-33-AB3-C-R_C171498.html